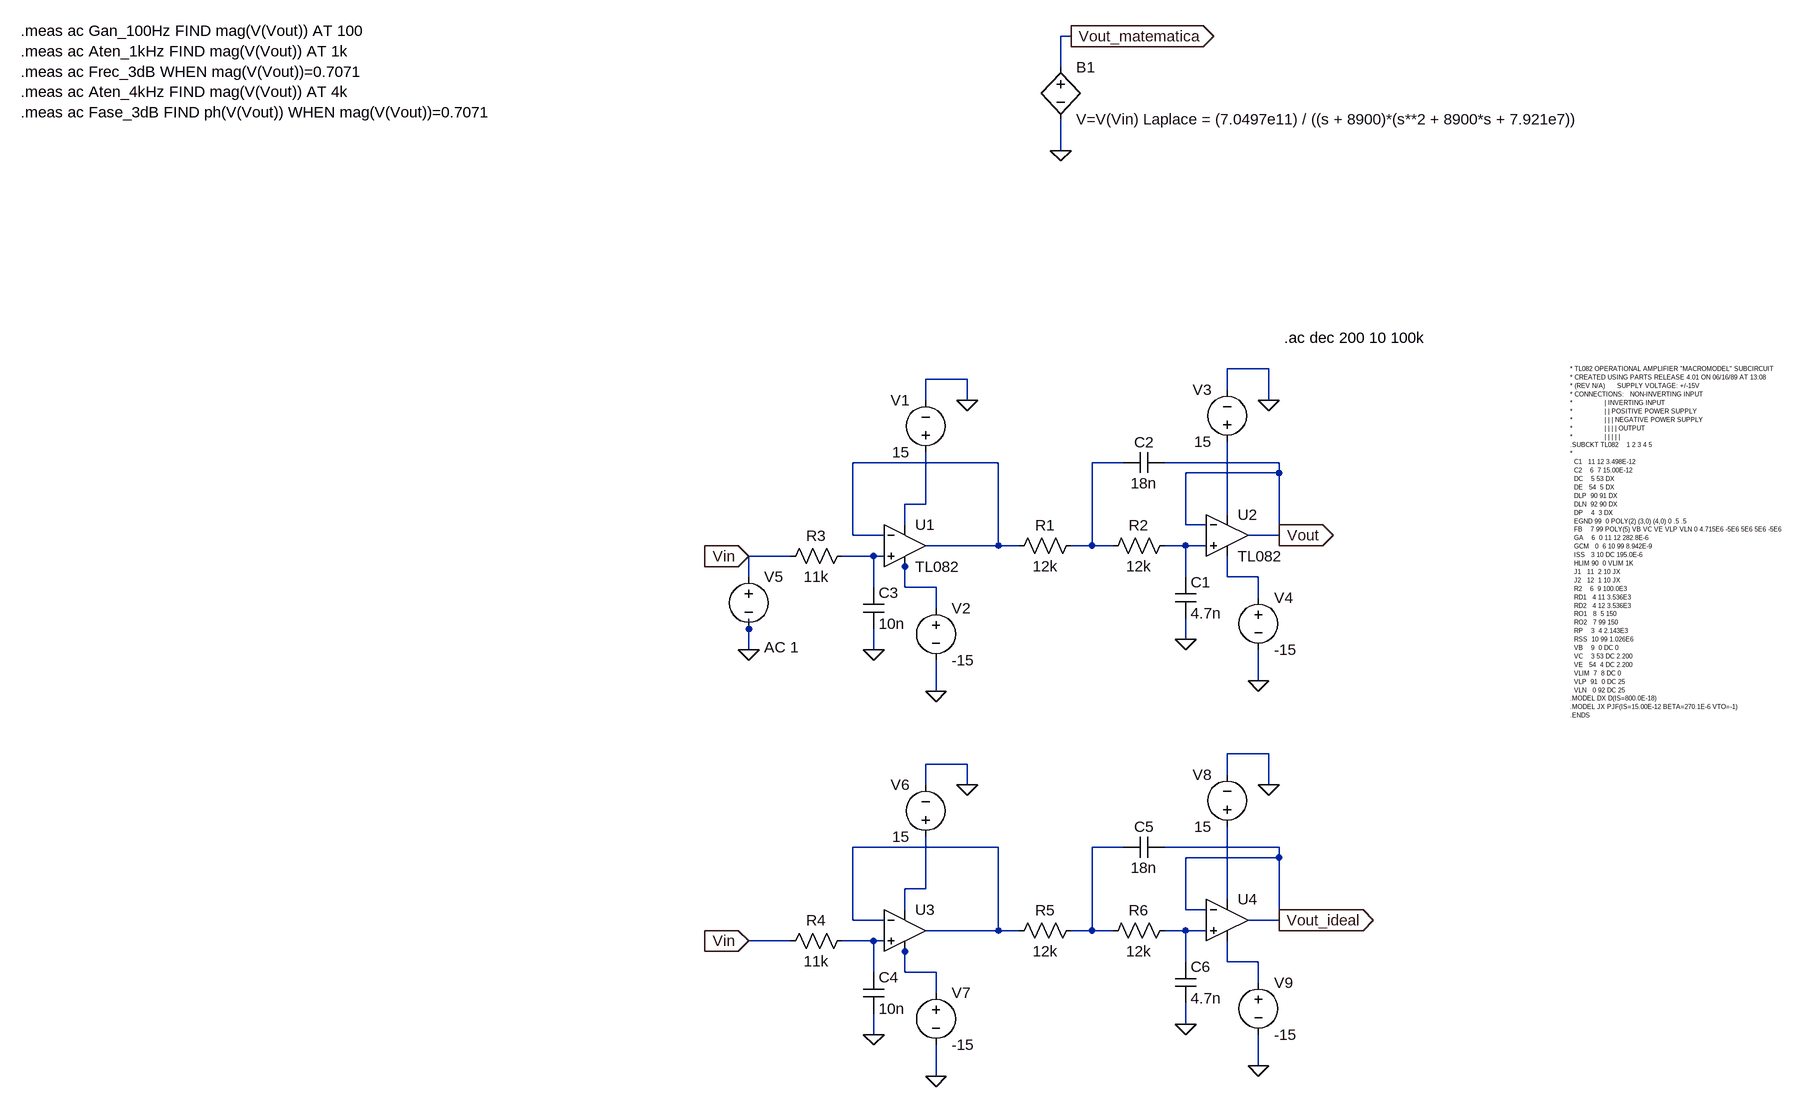
[diagram p0: schematic FiltroPasaBajo.asc]
FiltroPasaBajo.asc, the LTspice schematic file:
Version 4.1
SHEET 1 1340 1492
WIRE 240 -720 224 -720
WIRE 224 -672 224 -720
WIRE 224 -544 224 -592
WIRE 544 -208 480 -208
WIRE 80 -192 16 -192
WIRE 480 -176 480 -208
WIRE 16 -160 16 -192
WIRE 80 -160 80 -192
WIRE 544 -160 544 -208
WIRE 128 -64 -96 -64
WIRE 320 -64 272 -64
WIRE 560 -64 384 -64
WIRE 560 -48 560 -64
WIRE 560 -48 416 -48
WIRE 16 0 16 -80
WIRE 16 0 -16 0
WIRE 480 16 480 -96
WIRE -16 32 -16 0
WIRE 416 32 416 -48
WIRE 448 32 416 32
WIRE -96 48 -96 -64
WIRE -48 48 -96 48
WIRE 560 48 560 -48
WIRE 560 48 512 48
WIRE 128 64 128 -64
WIRE 128 64 16 64
WIRE 160 64 128 64
WIRE 272 64 272 -64
WIRE 272 64 240 64
WIRE 304 64 272 64
WIRE 416 64 384 64
WIRE 448 64 416 64
WIRE -192 80 -256 80
WIRE -64 80 -112 80
WIRE -48 80 -64 80
WIRE -16 96 -16 80
WIRE -256 112 -256 80
WIRE 416 112 416 64
WIRE 480 112 480 80
WIRE 528 112 480 112
WIRE -64 128 -64 80
WIRE -16 128 -16 96
WIRE 32 128 -16 128
WIRE 528 144 528 112
WIRE 32 160 32 128
WIRE -256 192 -256 176
WIRE 416 208 416 176
WIRE -256 224 -256 192
WIRE -64 224 -64 192
WIRE 528 272 528 224
WIRE 32 288 32 240
WIRE 544 384 480 384
WIRE 80 400 16 400
WIRE 480 416 480 384
WIRE 16 432 16 400
WIRE 80 432 80 400
WIRE 544 432 544 384
WIRE 128 528 -96 528
WIRE 320 528 272 528
WIRE 560 528 384 528
WIRE 560 544 560 528
WIRE 560 544 416 544
WIRE 16 592 16 512
WIRE 16 592 -16 592
WIRE 480 608 480 496
WIRE -16 624 -16 592
WIRE 416 624 416 544
WIRE 448 624 416 624
WIRE -96 640 -96 528
WIRE -48 640 -96 640
WIRE 560 640 560 544
WIRE 560 640 512 640
WIRE 128 656 128 528
WIRE 128 656 16 656
WIRE 160 656 128 656
WIRE 272 656 272 528
WIRE 272 656 240 656
WIRE 304 656 272 656
WIRE 416 656 384 656
WIRE 448 656 416 656
WIRE -192 672 -256 672
WIRE -64 672 -112 672
WIRE -48 672 -64 672
WIRE -16 688 -16 672
WIRE 416 704 416 656
WIRE 480 704 480 672
WIRE 528 704 480 704
WIRE -64 720 -64 672
WIRE -16 720 -16 688
WIRE 32 720 -16 720
WIRE 528 736 528 704
WIRE 32 752 32 720
WIRE 416 800 416 768
WIRE -64 816 -64 784
WIRE 528 864 528 816
WIRE 32 880 32 832
FLAG -64 224 0
FLAG 416 208 0
FLAG 80 -160 0
FLAG 544 -160 0
FLAG 32 288 0
FLAG 528 272 0
FLAG -256 224 0
FLAG -256 80 Vin
IOPIN -256 80 In
FLAG 560 48 Vout
IOPIN 560 48 Out
FLAG -64 816 0
FLAG 416 800 0
FLAG 80 432 0
FLAG 544 432 0
FLAG 32 880 0
FLAG 528 864 0
FLAG -256 672 Vin
IOPIN -256 672 In
FLAG 560 640 Vout_ideal
IOPIN 560 640 Out
FLAG 224 -544 0
FLAG 240 -720 Vout_matematica
IOPIN 240 -720 Out
SYMBOL cap -80 128 R0
SYMATTR InstName C3
SYMATTR Value 10n
SYMBOL res -96 64 R90
WINDOW 0 0 56 VBottom 2
WINDOW 3 32 56 VTop 2
SYMATTR InstName R3
SYMATTR Value 11k
SYMBOL res 256 48 R90
WINDOW 0 0 56 VBottom 2
WINDOW 3 32 56 VTop 2
SYMATTR InstName R1
SYMATTR Value 12k
SYMBOL res 400 48 R90
WINDOW 0 0 56 VBottom 2
WINDOW 3 32 56 VTop 2
SYMATTR InstName R2
SYMATTR Value 12k
SYMBOL cap 384 -80 R90
WINDOW 0 0 32 VBottom 2
WINDOW 3 32 32 VTop 2
SYMATTR InstName C2
SYMATTR Value 18n
SYMBOL cap 400 112 R0
SYMATTR InstName C1
SYMATTR Value 4.7n
SYMBOL voltage 16 -64 R180
WINDOW 0 24 96 Left 2
WINDOW 3 24 16 Left 2
WINDOW 123 0 0 Left 0
WINDOW 39 0 0 Left 0
SYMATTR InstName V1
SYMATTR Value 15
SYMBOL voltage 32 144 R0
WINDOW 123 0 0 Left 0
WINDOW 39 0 0 Left 0
SYMATTR InstName V2
SYMATTR Value -15
SYMBOL voltage 480 -80 R180
WINDOW 0 24 96 Left 2
WINDOW 3 24 16 Left 2
WINDOW 123 0 0 Left 0
WINDOW 39 0 0 Left 0
SYMATTR InstName V3
SYMATTR Value 15
SYMBOL voltage 528 128 R0
WINDOW 123 0 0 Left 0
WINDOW 39 0 0 Left 0
SYMATTR InstName V4
SYMATTR Value -15
SYMBOL voltage -256 96 R0
WINDOW 123 24 124 Left 2
WINDOW 39 0 0 Left 0
SYMATTR Value2 AC 1
SYMATTR InstName V5
SYMATTR Value ""
SYMBOL OpAmps\\opamp2 -16 0 R0
SYMATTR InstName U1
SYMATTR Value TL082
SYMBOL OpAmps\\opamp2 480 -16 R0
SYMATTR InstName U2
SYMATTR Value TL082
SYMBOL cap -80 720 R0
SYMATTR InstName C4
SYMATTR Value 10n
SYMBOL res -96 656 R90
WINDOW 0 0 56 VBottom 2
WINDOW 3 32 56 VTop 2
SYMATTR InstName R4
SYMATTR Value 11k
SYMBOL res 256 640 R90
WINDOW 0 0 56 VBottom 2
WINDOW 3 32 56 VTop 2
SYMATTR InstName R5
SYMATTR Value 12k
SYMBOL res 400 640 R90
WINDOW 0 0 56 VBottom 2
WINDOW 3 32 56 VTop 2
SYMATTR InstName R6
SYMATTR Value 12k
SYMBOL cap 384 512 R90
WINDOW 0 0 32 VBottom 2
WINDOW 3 32 32 VTop 2
SYMATTR InstName C5
SYMATTR Value 18n
SYMBOL cap 400 704 R0
SYMATTR InstName C6
SYMATTR Value 4.7n
SYMBOL voltage 16 528 R180
WINDOW 0 24 96 Left 2
WINDOW 3 24 16 Left 2
WINDOW 123 0 0 Left 0
WINDOW 39 0 0 Left 0
SYMATTR InstName V6
SYMATTR Value 15
SYMBOL voltage 32 736 R0
WINDOW 123 0 0 Left 0
WINDOW 39 0 0 Left 0
SYMATTR InstName V7
SYMATTR Value -15
SYMBOL voltage 480 512 R180
WINDOW 0 24 96 Left 2
WINDOW 3 24 16 Left 2
WINDOW 123 0 0 Left 0
WINDOW 39 0 0 Left 0
SYMATTR InstName V8
SYMATTR Value 15
SYMBOL voltage 528 720 R0
WINDOW 123 0 0 Left 0
WINDOW 39 0 0 Left 0
SYMATTR InstName V9
SYMATTR Value -15
SYMBOL OpAmps\\UniversalOpAmp2 -16 656 R0
SYMATTR InstName U3
SYMBOL OpAmps\\UniversalOpAmp2 480 640 R0
SYMATTR InstName U4
SYMBOL bv 224 -688 R0
SYMATTR InstName B1
SYMATTR Value V=V(Vin) Laplace = (7.0497e11) / ((s + 8900)*(s**2 + 8900*s + 7.921e7))
TEXT 568 -256 Left 2 !.ac dec 200 10 100k
TEXT 1008 -208 Left 0 !* TL082 OPERATIONAL AMPLIFIER "MACROMODEL" SUBCIRCUIT\n* CREATED USING PARTS RELEASE 4.01 ON 06/16/89 AT 13:08\n* (REV N/A)      SUPPLY VOLTAGE: +/-15V\n* CONNECTIONS:   NON-INVERTING INPUT\n*                | INVERTING INPUT\n*                | | POSITIVE POWER SUPPLY\n*                | | | NEGATIVE POWER SUPPLY\n*                | | | | OUTPUT\n*                | | | | |\n.SUBCKT TL082    1 2 3 4 5\n*\n  C1   11 12 3.498E-12\n  C2    6  7 15.00E-12\n  DC    5 53 DX\n  DE   54  5 DX\n  DLP  90 91 DX\n  DLN  92 90 DX\n  DP    4  3 DX\n  EGND 99  0 POLY(2) (3,0) (4,0) 0 .5 .5\n  FB    7 99 POLY(5) VB VC VE VLP VLN 0 4.715E6 -5E6 5E6 5E6 -5E6\n  GA    6  0 11 12 282.8E-6\n  GCM   0  6 10 99 8.942E-9\n  ISS   3 10 DC 195.0E-6\n  HLIM 90  0 VLIM 1K\n  J1   11  2 10 JX\n  J2   12  1 10 JX\n  R2    6  9 100.0E3\n  RD1   4 11 3.536E3\n  RD2   4 12 3.536E3\n  RO1   8  5 150\n  RO2   7 99 150\n  RP    3  4 2.143E3\n  RSS  10 99 1.026E6\n  VB    9  0 DC 0\n  VC    3 53 DC 2.200\n  VE   54  4 DC 2.200\n  VLIM  7  8 DC 0\n  VLP  91  0 DC 25\n  VLN   0 92 DC 25\n.MODEL DX D(IS=800.0E-18)\n.MODEL JX PJF(IS=15.00E-12 BETA=270.1E-6 VTO=-1)\n.ENDS
TEXT -1376 -728 Left 2 !.meas ac Gan_100Hz FIND mag(V(Vout)) AT 100\n.meas ac Aten_1kHz FIND mag(V(Vout)) AT 1k\n.meas ac Frec_3dB WHEN mag(V(Vout))=0.7071\n.meas ac Aten_4kHz FIND mag(V(Vout)) AT 4k\n.meas ac Fase_3dB FIND ph(V(Vout)) WHEN mag(V(Vout))=0.7071

The netlist it stands for:
* FiltroPasaBajo.asc
C3 N006 0 10n
R3 N006 Vin 11k
R1 N002 N001 12k
R2 N005 N002 12k
C2 Vout N002 18n
C1 N005 0 4.7n
V1 N003 0 15
V2 N007 0 -15
V3 N004 0 15
V4 N008 0 -15
V5 Vin 0 AC 1
X§U1 N006 N001 N003 N007 N001 TL082  ; pins In+ In- V+ V- OUT
X§U2 N005 Vout N004 N008 Vout TL082  ; pins In+ In- V+ V- OUT
C4 N014 0 10n
R4 N014 Vin 11k
R5 N010 N009 12k
R6 N013 N010 12k
C5 Vout_ideal N010 18n
C6 N013 0 4.7n
V6 N011 0 15
V7 N015 0 -15
V8 N012 0 15
V9 N016 0 -15
X§U3 N014 N009 N011 N015 N009 level2 Avol=1Meg GBW=10Meg Slew=10Meg Ilimit=25m Rail=0 Vos=0 En=0 Enk=0 In=0 Ink=0 Rin=500Meg  ; pins In+ In- V+ V- OUT
X§U4 N013 Vout_ideal N012 N016 Vout_ideal level2 Avol=1Meg GBW=10Meg Slew=10Meg Ilimit=25m Rail=0 Vos=0 En=0 Enk=0 In=0 Ink=0 Rin=500Meg  ; pins In+ In- V+ V- OUT
B1 Vout_matematica 0 V=V(Vin) Laplace = (7.0497e11) / ((s + 8900)*(s**2 + 8900*s + 7.921e7))
.ac dec 200 10 100k
* TL082 OPERATIONAL AMPLIFIER "MACROMODEL" SUBCIRCUIT
* CREATED USING PARTS RELEASE 4.01 ON 06/16/89 AT 13:08
* (REV N/A)      SUPPLY VOLTAGE: +/-15V
* CONNECTIONS:   NON-INVERTING INPUT
*                | INVERTING INPUT
*                | | POSITIVE POWER SUPPLY
*                | | | NEGATIVE POWER SUPPLY
*                | | | | OUTPUT
*                | | | | |
.SUBCKT TL082    1 2 3 4 5
*
  C1   11 12 3.498E-12
  C2    6  7 15.00E-12
  DC    5 53 DX
  DE   54  5 DX
  DLP  90 91 DX
  DLN  92 90 DX
  DP    4  3 DX
  EGND 99  0 POLY(2) (3,0) (4,0) 0 .5 .5
  FB    7 99 POLY(5) VB VC VE VLP VLN 0 4.715E6 -5E6 5E6 5E6 -5E6
  GA    6  0 11 12 282.8E-6
  GCM   0  6 10 99 8.942E-9
  ISS   3 10 DC 195.0E-6
  HLIM 90  0 VLIM 1K
  J1   11  2 10 JX
  J2   12  1 10 JX
  R2    6  9 100.0E3
  RD1   4 11 3.536E3
  RD2   4 12 3.536E3
  RO1   8  5 150
  RO2   7 99 150
  RP    3  4 2.143E3
  RSS  10 99 1.026E6
  VB    9  0 DC 0
  VC    3 53 DC 2.200
  VE   54  4 DC 2.200
  VLIM  7  8 DC 0
  VLP  91  0 DC 25
  VLN   0 92 DC 25
.MODEL DX D(IS=800.0E-18)
.MODEL JX PJF(IS=15.00E-12 BETA=270.1E-6 VTO=-1)
.ENDS
.meas ac Gan_100Hz FIND mag(V(Vout)) AT 100
.meas ac Aten_1kHz FIND mag(V(Vout)) AT 1k
.meas ac Frec_3dB WHEN mag(V(Vout))=0.7071
.meas ac Aten_4kHz FIND mag(V(Vout)) AT 4k
.meas ac Fase_3dB FIND ph(V(Vout)) WHEN mag(V(Vout))=0.7071
.lib UniversalOpAmp2.lib
.backanno
.end